# Altium schematic sheet 04_GPIO_Header.SchDoc
size A3; SheetNumber: 4; SheetTotal: 4
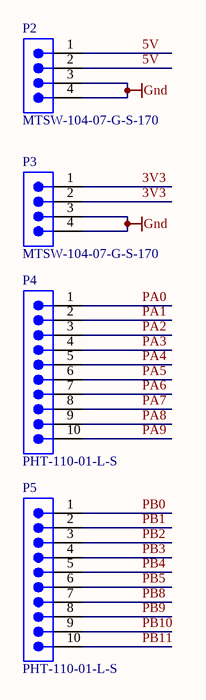
[diagram p0: 04_GPIO_Header.SchDoc]

## Parts
P2  MTSW-104-07-G-S-170  [SMTC-MTSW-104-07-X-S-170]
P3  MTSW-104-07-G-S-170  [SMTC-MTSW-104-07-X-S-170]
P4  PHT-110-01-L-S  [SMTC-PHT-110-01-X-S]
P5  PHT-110-01-L-S  [SMTC-PHT-110-01-X-S]

## Nets
Gnd: P2.3 P2.4 P3.3 P3.4
3V3: P3.1 P3.2
5V: P2.1 P2.2
PA0: P4.1
PA1: P4.2
PA2: P4.3
PA3: P4.4
PA4: P4.5
PA5: P4.6
PA6: P4.7
PA7: P4.8
PA8: P4.9
PA9: P4.10
PB0: P5.1
PB1: P5.2
PB2: P5.3
PB3: P5.4
PB4: P5.5
PB5: P5.6
PB8: P5.7
PB9: P5.8
PB10: P5.9
PB11: P5.10

## Library data of the parts
P2 P3 = CMP-1024-00104-1: Modified .025" SQ Post Header, Through-hole, Vertical, -55 to 125 degC, 2.54 mm Pitch, 4-Pin, Male, RoHS; Manufacturer: Samtec; Pitch: 2.54 mm; Temperature Range: -55 to 125 degC; ComponentLink1URL: http://www.samtec.com; ComponentLink1Description: Manufacturer URL; ComponentLink3URL: http://www.samtec.com/documents/webfiles/cpdf/MTSW-XXX-XX-X-X-XXXX-XX-XXX-MKT1.pdf; DatasheetVersion: F-214; Orientation: Vertical; ComponentLink3Description: Package Specification; PackageReference: MTSW-104-07-X-S-170; PackageDescription: Assembly .025" [.64] SQ Post Terminal Strip; ComponentLink2Description: Datasheet; PackageVersion: BI, 2/1987; ComponentLink2URL: http://www.samtec.com/documents/webfiles/pdf/MTSW.PDF; PartNumber: MTSW-104-07-G-S-170; Mounting Technology: Through-hole; RoHS: True
P4 P5 = CMP-1024-00195-1: Press Fit Header, Through-hole, Vertical, -55 to 125 degC, 2.54 mm Pitch, 10-Pin, Male, RoHS; Manufacturer: Samtec; Pitch: 2.54 mm; PartNumber: PHT-110-01-L-S; ComponentLink3URL: http://www.samtec.com/documents/webfiles/cpdf/PHT-1XX-XX-X-X-XXX-MKT.pdf; DatasheetVersion: F-214; PackageReference: PHT-110-01-X-S; Mounting Technology: Through-hole; Orientation: Vertical; ComponentLink3Description: Package Specification; ComponentLink2URL: http://www.samtec.com/documents/webfiles/pdf/pht.pdf; ComponentLink1URL: http://www.samtec.com; ComponentLink2Description: Datasheet; PackageDescription: .100 Press Fit Socket Assembly; RoHS: True; PackageVersion: J, 9/2009; ComponentLink1Description: Manufacturer URL; Temperature Range: -55 to 125 degC